# Altium schematic sheet Turret_ADC_Protection.SchDoc: Protection ADC
size Letter; ApprovedBy: APPROUVÉ PAR; Author: Alexandre Dionne; Organization: Cegep Limoilou; Address1: 1300, 8e Avenue; Address2: Québec, QC; Address3: Canada; Address4: G1J 5L5; Revision: A; SheetNumber: 2; SheetTotal: 3
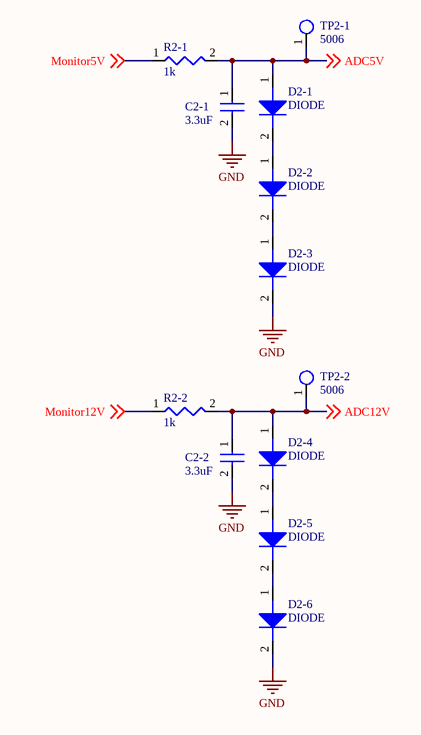
[diagram p0: Turret_ADC_Protection.SchDoc]

## Parts
C2-1  3.3uF  [CAP_0603]
C2-2  3.3uF  [CAP_0603]
D2-1  DIODE  [CD214A-B160R]
D2-2  DIODE  [CD214A-B160R]
D2-3  DIODE  [CD214A-B160R]
D2-4  DIODE  [CD214A-B160R]
D2-5  DIODE  [CD214A-B160R]
D2-6  DIODE  [CD214A-B160R]
R2-1  1k  [RES_0603]
R2-2  1k  [RES_0603]
TP2-1  5006  [TestPoint]
TP2-2  5006  [TestPoint]

## Nets
GND: C2-1.2 C2-2.2 D2-3.2(CATHODE) D2-6.2(CATHODE)
ADC5V: C2-1.1 D2-1.1(ANODE) R2-1.2 TP2-1.1 ; off-sheet ADC5V
ADC12V: C2-2.1 D2-4.1(ANODE) R2-2.2 TP2-2.1 ; off-sheet ADC12V
Monitor5V: R2-1.1 ; off-sheet Monitor5V
Monitor12V: R2-2.1 ; off-sheet Monitor12V
NetD2-1_2: D2-1.2(CATHODE) D2-2.1(ANODE)
NetD2-2_2: D2-2.2(CATHODE) D2-3.1(ANODE)
NetD2-4_2: D2-4.2(CATHODE) D2-5.1(ANODE)
NetD2-5_2: D2-5.2(CATHODE) D2-6.1(ANODE)

## Notes on the sheet
- Titre :
- Conception :
- Date :
- Approbation :
- Heure :
- Révision :
- Feuille
- de
- Fichier :

## Library data of the parts
C2-1 C2-2 = CAP NP
R2-1 R2-2 = R
TP2-1 TP2-2 = Test_Point